# Altium project Clema TEC-PDB V1.PrjPcb
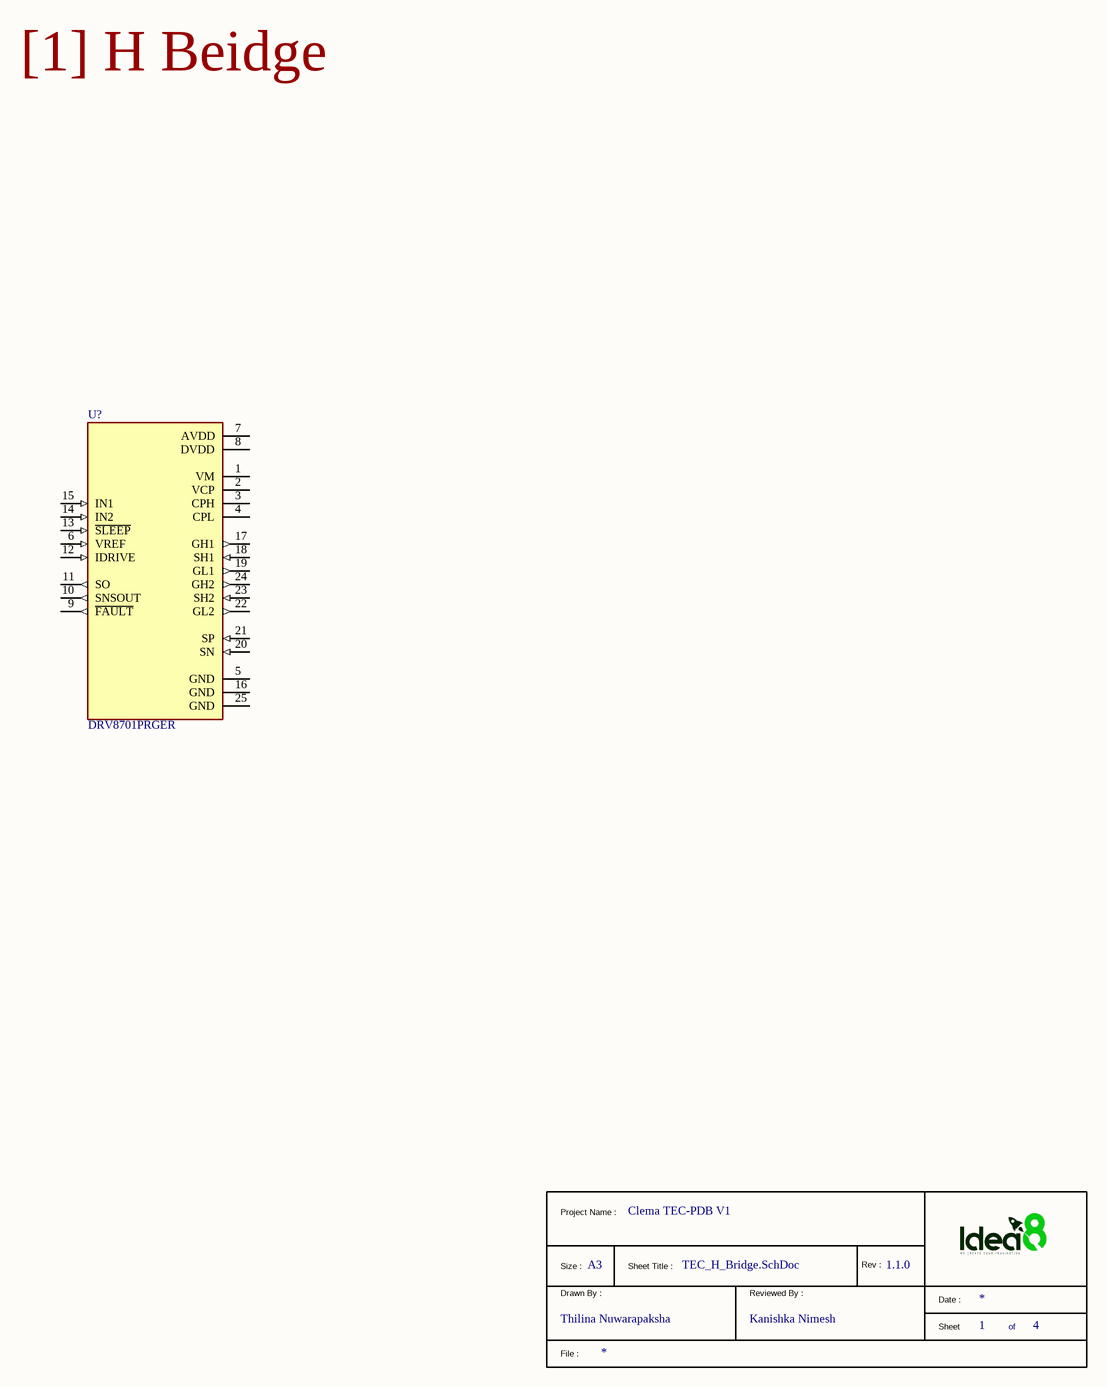
[diagram p0: TEC_H_Bridge.SchDoc]
Title: Clema TEC-PDB V1; Revision: 1.1.0; DrawnBy: Thilina Nuwarapaksha; CheckedBy: Kanishka Nimesh
3 sheets, 27 parts. Net scope: global (net labels, ports and power ports of the same name join across sheets).
Sheets:
  TEC_H_Bridge.SchDoc
  Buck_Boost_Converter.SchDoc
  Power ORing & Monitor.SchDoc

## Sheet TEC_H_Bridge.SchDoc: Clema TEC-PDB V1
size A3; SheetNumber: 1; SheetTotal: 4; SheetSize: A3

### Parts
(Parts that share a designator on the sheet are numbered #1, #2 ... from top to bottom, then left to right.)
*#1  TitleBlock1  (value not drawn)  (graphical)
U?#1  DRV8701PRGER  [DRV8701PRGER_VQFN-24-EP(4x4)]

### Nets

Not connected (* = marked no-connect by the designer): U?#1 1(VM) 2(VCP) 3(CPH) 4(CPL) 5(GND) 6(VREF) 7(AVDD) 8(DVDD) 9(~{FAULT}) 10(SNSOUT) 11(SO) 12(IDRIVE) 13(~{SLEEP}) 14(IN2) 15(IN1) 16(GND) 17(GH1) 18(SH1) 19(GL1) 20(SN) 21(SP) 22(GL2) 23(SH2) 24(GH2) 25(GND)

### Notes on the sheet
- [1] H Beidge
- (in symbol TitleBlock1) Project Name :; Size :; Sheet Title :; Rev :; Drawn By :; Reviewed By :; Date :; Sheet; of; File :

### Library data of the parts
U?#1 = TI DRV8701PRGER: Brushed DC Motor Full-Bridge Gate Driver; Manufacturer: TI; Manufacturer Part Number: DRV8701PRGER; DigiKey Part Number: 296-46293-2-ND; LCSC Part Number: C114178; Mouser Part Number: 595-DRV8701PRGER; Package: VQFN-24-EP(4x4); Type: SMD

## Sheet Buck_Boost_Converter.SchDoc: Clema TEC-PDB V1
size A3; SheetNumber: 2; SheetTotal: 4; SheetSize: A3
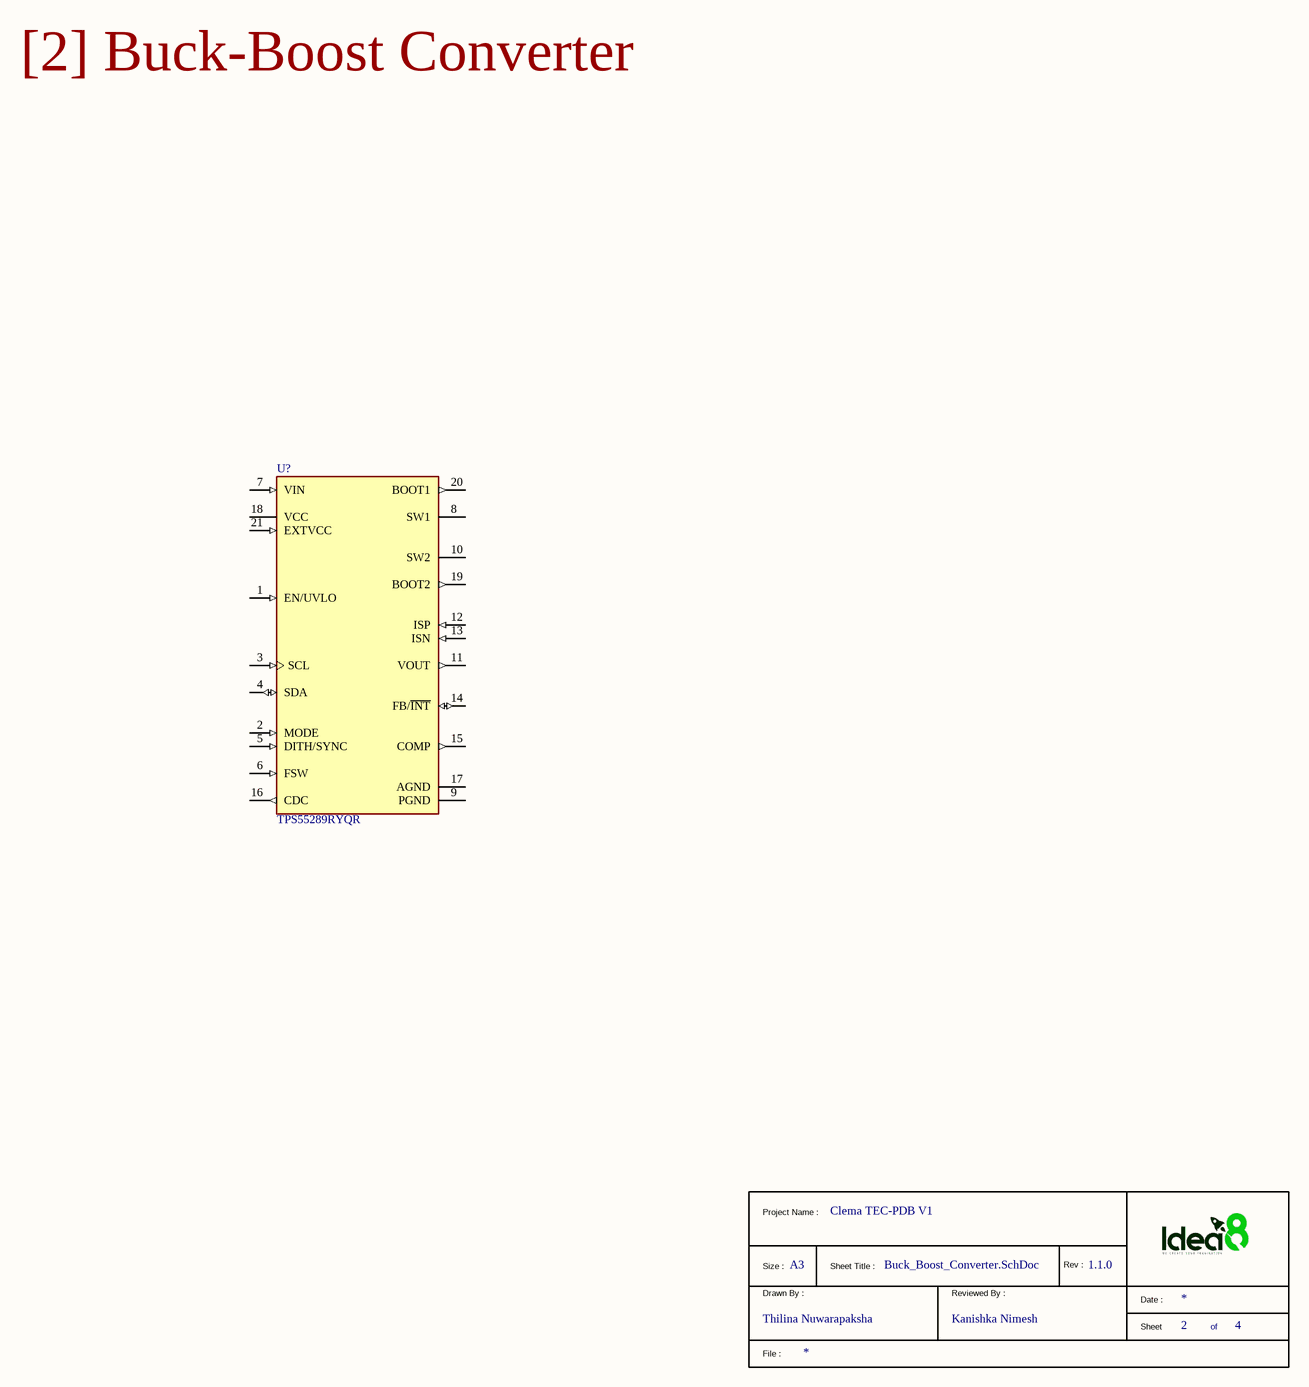
[diagram p1: Buck_Boost_Converter.SchDoc]

### Parts
(Parts that share a designator on the sheet are numbered #1, #2 ... from top to bottom, then left to right.)
*#2  TitleBlock1  (value not drawn)  (graphical)
U?#2  TPS55289RYQR  [TPS55289RYQR_VQFN-HR-21(3x5)]

### Nets

Not connected (* = marked no-connect by the designer): U?#2 1(EN/UVLO) 2(MODE) 3(SCL) 4(SDA) 5(DITH/SYNC) 6(FSW) 7(VIN) 8(SW1) 9(PGND) 10(SW2) 11(VOUT) 12(ISP) 13(ISN) 14(FB/~{INT}) 15(COMP) 16(CDC) 17(AGND) 18(VCC) 19(BOOT2) 20(BOOT1) 21(EXTVCC)

### Notes on the sheet
- [2] Buck-Boost Converter
- (in symbol TitleBlock1) Project Name :; Size :; Sheet Title :; Rev :; Drawn By :; Reviewed By :; Date :; Sheet; of; File :

### Library data of the parts
U?#2 = TI TPS55289RYQR: TPS55289 Synchronous Buck-Boost Converter; Manufacturer: TI; Manufacturer Part Number: TPS55289RYQR; DigiKey Part Number: 296-TPS55289RYQRTR-ND; LCSC Part Number: C5942077; Package: VQFN-HR-21(3x5); Type: SMD

## Sheet Power ORing & Monitor.SchDoc: Clema TEC-PDB V1
size A2; SheetNumber: 3; SheetTotal: 3; SheetSize: A3
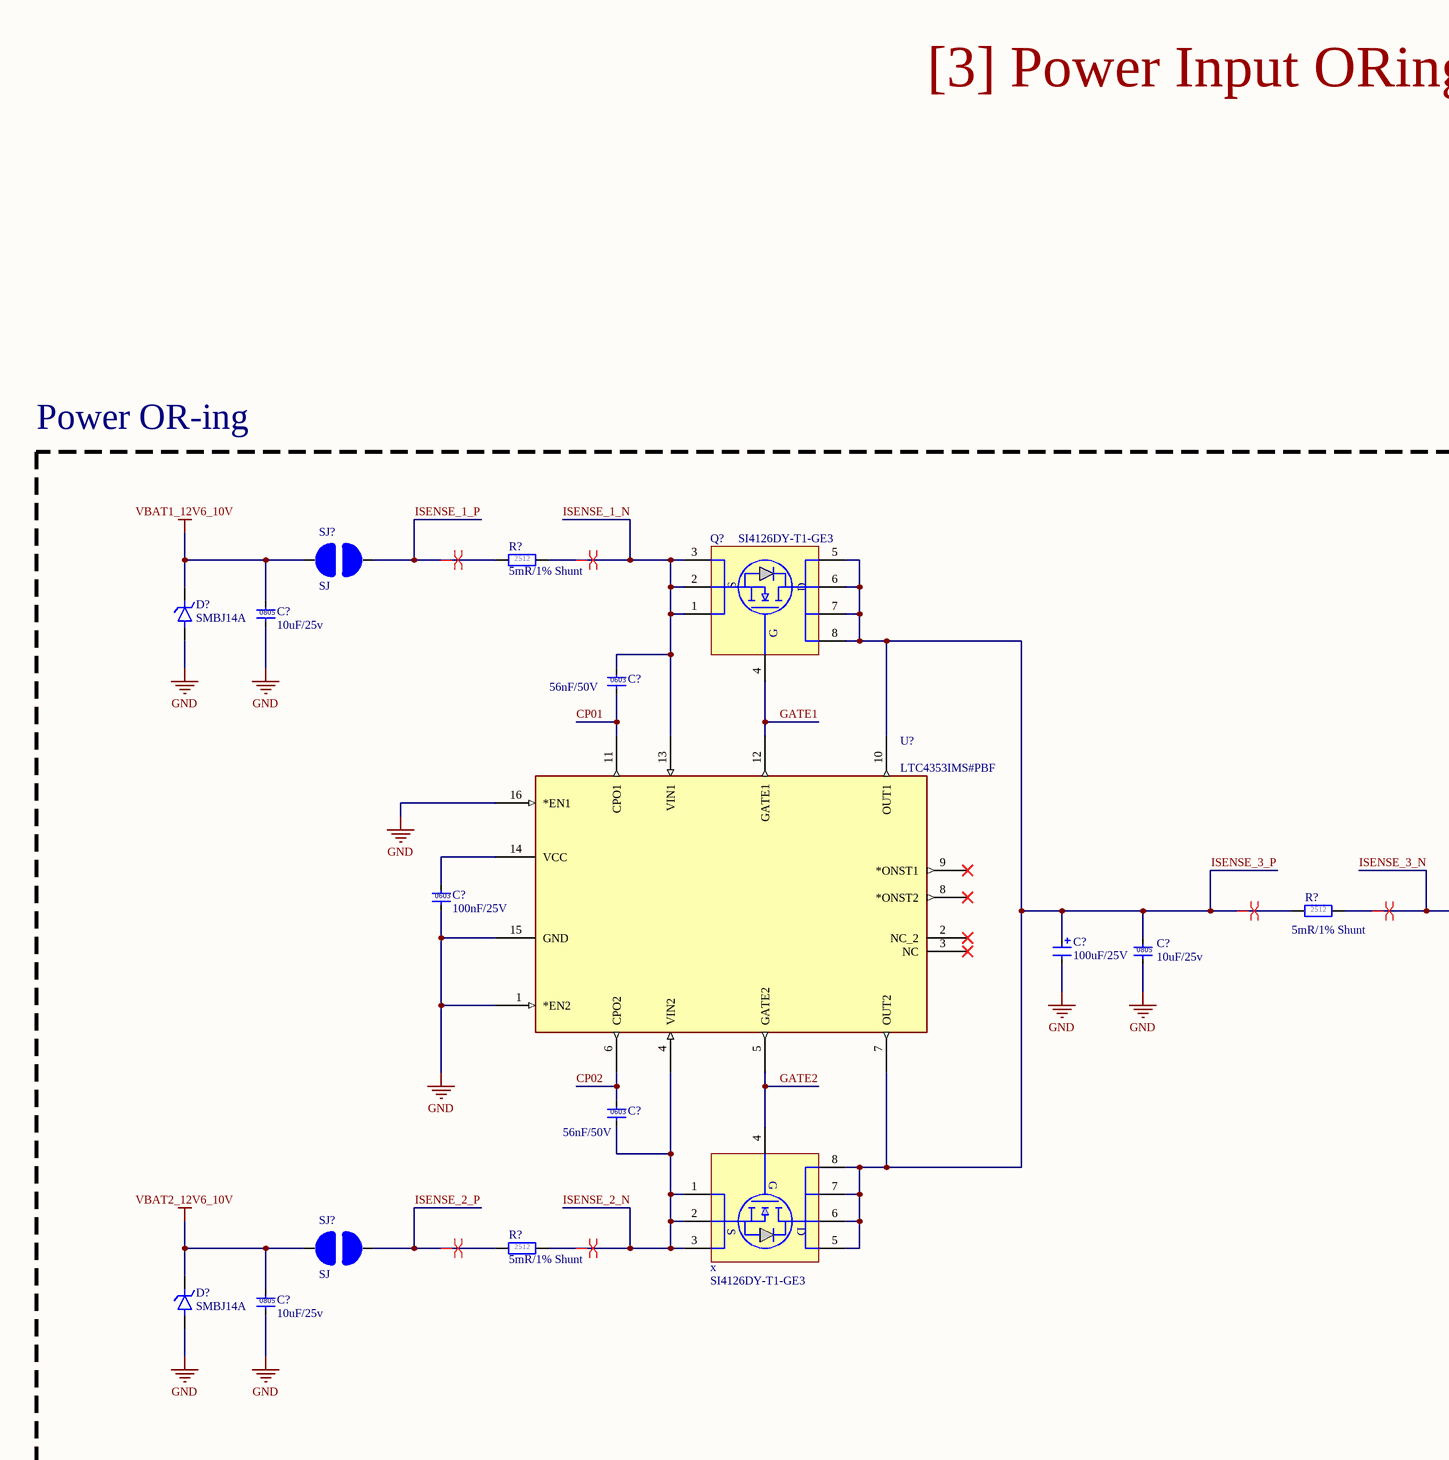
[diagram p2: Power ORing & Monitor.SchDoc, left]
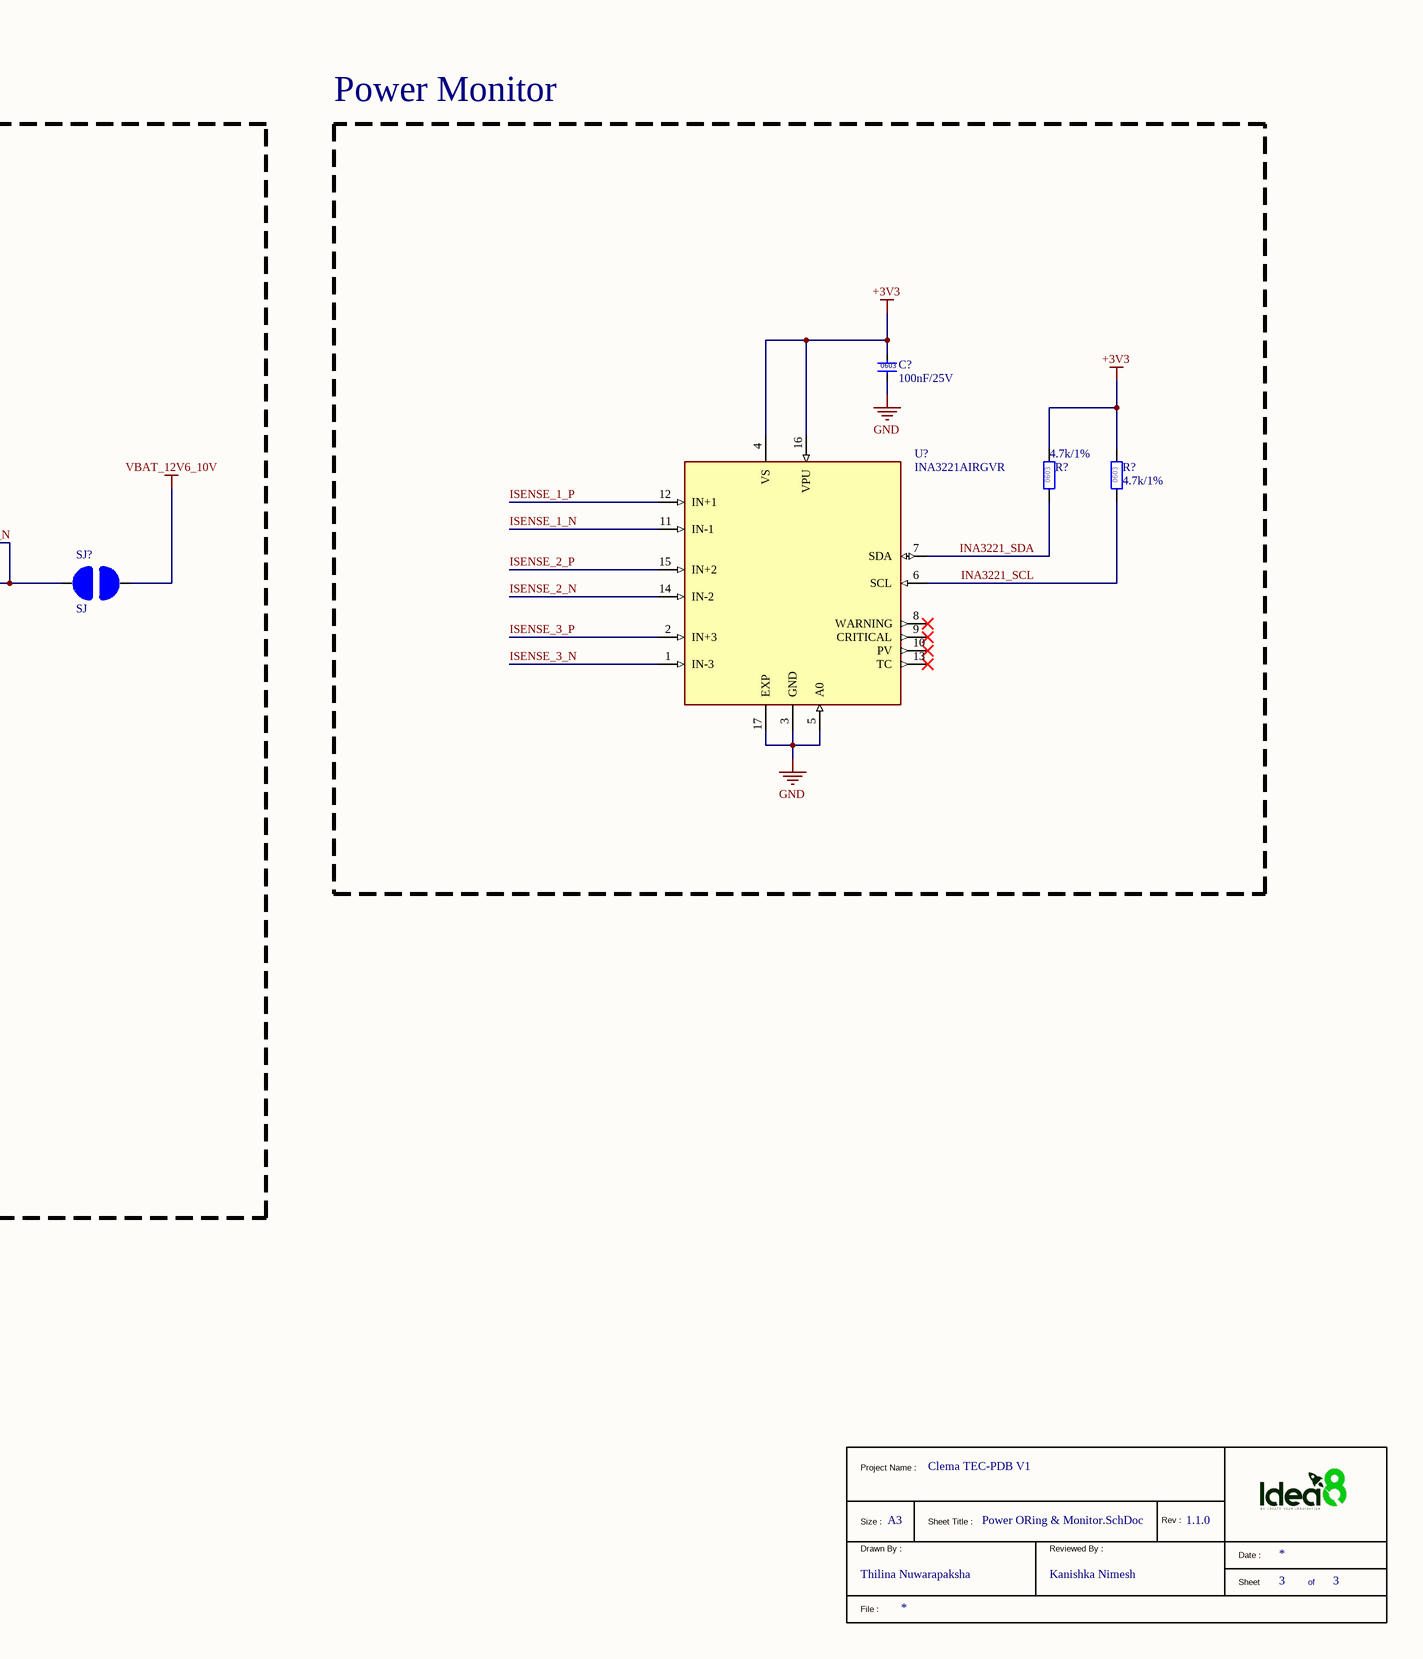
[diagram p3: Power ORing & Monitor.SchDoc, right]

### Parts
(Parts that share a designator on the sheet are numbered #1, #2 ... from top to bottom, then left to right.)
*#3  TitleBlock1  (value not drawn)  (graphical)
C?#1  10uF/25v  [CAP_0805]
C?#2  56nF/50V  [CAP_0603]
C?#3  100nF/25V  [CAP_0603]
C?#4  100nF/25V  [CAP_0603]
C?#5  100uF/25V  [CAP_SMD,D6.3xL7.7mm]
C?#6  10uF/25v  [CAP_0805]
C?#7  56nF/50V  [CAP_0603]
C?#8  10uF/25v  [CAP_0805]
D?#1  SMBJ14A  [SMBJ14A_DO-214AA]
D?#2  SMBJ14A  [SMBJ14A_DO-214AA]
Q?  SI4126DY-T1-GE3  [SI4126DY-T1-GE3_SOIC-8]
R?#1  5mR/1% Shunt  [RES_2512]
R?#2  4.7k/1%  [RES_0603]
R?#3  4.7k/1%  [RES_0603]
R?#4  5mR/1% Shunt  [RES_2512]
R?#5  5mR/1% Shunt  [RES_2512]
SJ?#1  SJ  [SJ_1]
SJ?#2  SJ  [SJ_1]
SJ?#3  SJ  [SJ_1]
U?#3  INA3221AIRGVR  [INA3221AIRGVR_QFN-16-EP(4x4)]
U?#4  LTC4353IMS#PBF  [LTC4353IMS#PBF_MSOP-16]
x  SI4126DY-T1-GE3  [SI4126DY-T1-GE3_SOIC-8]

### Blocks framed on the sheet
Power OR-ing: C?#1 C?#2 C?#4-C?#8 D?#1 D?#2 Q? R?#1 R?#4 R?#5 SJ?#1-SJ?#3 U?#4 x
Power Monitor: C?#3 R?#2 R?#3 U?#3

### Nets
+3V3: C?#3.1 R?#2.2 R?#3.2 U?#3.4(VS) U?#3.16(VPU)
GND: C?#1.2 C?#3.2 C?#4.2 C?#5.2 C?#6.2 C?#8.2 D?#1.2 D?#2.2 U?#3.3(GND) U?#3.5(A0) U?#3.17(EXP) U?#4.1(*EN2) U?#4.15(GND) U?#4.16(*EN1)
VBAT1_12V6_10V: C?#1.1 D?#1.1 SJ?#1.2
VBAT2_12V6_10V: C?#8.1 D?#2.1 SJ?#3.2
VBAT_12V6_10V: SJ?#2.1
CP01: C?#2.2 U?#4.11(CPO1)
CP02: C?#7.1 U?#4.6(CPO2)
GATE1: Q?.4(G) U?#4.12(GATE1)
GATE2: U?#4.5(GATE2) x.4(G)
INA3221_SCL: R?#3.1 U?#3.6(SCL)
INA3221_SDA: R?#2.1 U?#3.7(SDA)
ISENSE_1_N: C?#2.1 Q?.1(S) Q?.2(S) Q?.3(S) R?#1.2 U?#3.11(IN-1) U?#4.13(VIN1)
ISENSE_1_P: R?#1.1 SJ?#1.1 U?#3.12(IN+1)
ISENSE_2_N: C?#7.2 R?#5.2 U?#3.14(IN-2) U?#4.4(VIN2) x.1(S) x.2(S) x.3(S)
ISENSE_2_P: R?#5.1 SJ?#3.1 U?#3.15(IN+2)
ISENSE_3_N: R?#4.2 SJ?#2.2 U?#3.1(IN-3)
ISENSE_3_P: C?#5.1 C?#6.1 Q?.5(D) Q?.6(D) Q?.7(D) Q?.8(D) R?#4.1 U?#3.2(IN+3) U?#4.7(OUT2) U?#4.10(OUT1) x.5(D) x.6(D) x.7(D) x.8(D)
NetC?#4_1: C?#4.1 U?#4.14(VCC)

Not connected (* = marked no-connect by the designer): U?#3 8(WARNING)* 9(CRITICAL)* 10(PV)* 13(TC)*; U?#4 2(NC_2)* 3(NC)* 8(*ONST2)* 9(*ONST1)*

### Layout directives
differential pair: ISENSE_1_N, ISENSE_1_P, ISENSE_2_N, ISENSE_2_P, ISENSE_3_N, ISENSE_3_P

### Notes on the sheet
- [3] Power Input ORing & Monitoring
- (in symbol TitleBlock1) Project Name :; Size :; Sheet Title :; Rev :; Drawn By :; Reviewed By :; Date :; Sheet; of; File :

### Library data of the parts
C?#1 C?#6 C?#8 = Samsung Electro-Mechanics CL21A106KAYNNNE: CAP CER 10uF 25V X5R 0805; Manufacturer Part Number: CC0805KKX7R6BB106; Type: SMD; Manufacturer: Samsung Electro-Mechanics; LCSC Part Number: C15850; Package: 0805
C?#2 C?#7 = YAGEO CC0603KRX7R9BB563: CAP CER 56nF 50V X7R 0603; Manufacturer: YAGEO; Type: SMD; Manufacturer Part Number: CC0603KRX7R9BB563; DigiKey Part Number: 311-4100-2-ND; LCSC Part Number: C282072; Mouser Part Number: 603-CC603KRX7R9BB563; Package: 0603
C?#3 C?#4 = YAGEO CC0603KRX7R8BB104: CAP CER 100nF 25V X7R 0603; Manufacturer: YAGEO; Type: SMD; Manufacturer Part Number: CC0603KRX7R8BB104; DigiKey Part Number: 311-1341-2-ND; LCSC Part Number: C92490; Mouser Part Number: 603-CC603KPX7R8BB104; Package: 0603
C?#5 = KEMET A768EB107M1ELAE036: CAP ALUM POLY 100uF ±20% 25V SMD; DigiKey Part Number: 399-A768EB107M1ELAE036TR-ND; LCSC Part Number: C1517619; Mouser Part Number: 80-A768EB107M1ELAE36; Package: SMD,D6.3xL6.0mm; Type: SMD
D?#1 D?#2 = Littelfuse SMBJ14A: TVS DIODE 14VWM 23.2VC DO-214AA; Type: SMD; Manufacturer: Littelfuse; Manufacturer Part Number: SMBJ14A; DigiKey Part Number: SMBJ14ABTR-ND; LCSC Part Number: C315990; Mouser Part Number: 504-SMBJE14A; Package: DO-214AA
Q? = SI4126DY-T1-GE3: 5W 30V 39A 3.4mΩ@4.5V 1 N-channel N-Channel SOIC-8 Single FETs, MOSFETs RoHS; Manufacturer: VISHAY; Type: SMD; Manufacturer Part Number: SI4126DY-T1-GE3; LCSC Part Number: C143747; Mouser Part Number: 781-SI4126DY-T1-GE3; Package: SOIC-8
R?#1 R?#4 R?#5 = Milliohm HoYLR2512-3W-5mR-1%: RES 5mΩ ±1% 3W 2512; Manufacturer: Milliohm; Manufacturer Part Number: HoYLR2512-3W-5mR-1%; DigiKey Part Number: 5705-HoYLR2512-3W-5mR-1%TR-ND; LCSC Part Number: C5375461; Package: 2512; Type: SMD
R?#2 R?#3 = YAGEO RC0603FR-074K7L: RES 4.7kΩ ±1% 100mW 0603; Manufacturer: YAGEO; Manufacturer Part Number: RC0603FR-074K7L; DigiKey Part Number: 311-4.70KHRTR-ND; LCSC Part Number: C99782; Mouser Part Number: 603-RC0603FR-074K7L; Package: 0603; Type: SMD
SJ?#1-SJ?#3 = SJ_1
U?#3 = TI INA3221AIRGVR: Triple-Channel, High-Side Measurement, Shunt and Bus Voltage Monitor with I²C- and SMBUS-Compatible Interface; Manufacturer: TI; Manufacturer Part Number: INA3221AIRGVR; DigiKey Part Number: 296-INA3221AIRGVRTR-ND; LCSC Part Number: C181255; Mouser Part Number: 595-INA3221AIRGVR; Package: QFN-16-EP(4x4); Type: SMD
U?#4 = ADI LTC4353IMS#PBF: MSOP-16 OR Controllers, Ideal Diodes RoHS; Manufacturer: ADI; Manufacturer Part Number: LTC4353IMS#PBF; LCSC Part Number: C117315; Mouser Part Number: 584-LTC4353IMS#PBF; Package: MSOP-16; Type: SMD
x = SI4126DY-T1-GE3: 5W 30V 39A 3.4mΩ@4.5V 1 N-channel N-Channel SOIC-8 Single FETs, MOSFETs RoHS; Manufacturer: VISHAY; Manufacturer Part Number: SI4126DY-T1-GE3; LCSC Part Number: C143747; Mouser Part Number: 781-SI4126DY-T1-GE3; Package: SOIC-8; Type: SMD